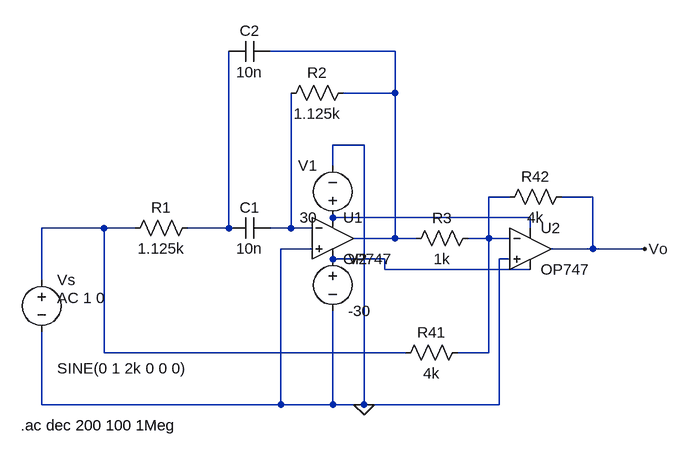
[diagram p0: schematic stage3_allpass_delay_45us_corrected.asc]
stage3_allpass_delay_45us_corrected.asc, the LTspice schematic file:
Version 4.1
SHEET 1 880 680
WIRE 304 -160 112 -160
WIRE 304 -96 304 -160
WIRE 304 -96 224 -96
WIRE 256 -16 208 -16
WIRE 208 16 208 -16
WIRE 480 64 448 64
WIRE 608 64 560 64
WIRE 512 96 208 96
WIRE -144 112 -240 112
WIRE -96 112 -144 112
WIRE 48 112 48 -160
WIRE 48 112 -16 112
WIRE 144 112 144 -96
WIRE 144 112 112 112
WIRE 176 112 144 112
WIRE 512 112 512 96
WIRE 304 128 304 -96
WIRE 304 128 240 128
WIRE 336 128 304 128
WIRE 448 128 448 64
WIRE 448 128 416 128
WIRE 480 128 448 128
WIRE 176 144 128 144
WIRE 608 144 608 64
WIRE 608 144 544 144
WIRE 688 144 608 144
WIRE 288 160 208 160
WIRE 480 160 464 160
WIRE 288 176 288 160
WIRE 512 176 288 176
WIRE -240 192 -240 112
WIRE -144 304 -144 112
WIRE 320 304 -144 304
WIRE 448 304 448 128
WIRE 448 304 400 304
WIRE -240 384 -240 272
WIRE 128 384 128 144
WIRE 128 384 -240 384
WIRE 208 384 208 240
WIRE 208 384 128 384
WIRE 256 384 256 -16
WIRE 256 384 208 384
WIRE 464 384 464 160
WIRE 464 384 256 384
FLAG 688 144 Vo
FLAG 256 384 0
SYMBOL OpAmps\\OP747 208 64 R0
SYMATTR InstName U1
SYMBOL OpAmps\\OP747 512 80 R0
SYMATTR InstName U2
SYMBOL cap 112 96 R90
WINDOW 0 0 32 VBottom 2
WINDOW 3 32 32 VTop 2
SYMATTR InstName C1
SYMATTR Value 10n
SYMBOL cap 112 -176 R90
WINDOW 0 0 32 VBottom 2
WINDOW 3 32 32 VTop 2
SYMATTR InstName C2
SYMATTR Value 10n
SYMBOL res 0 96 R90
WINDOW 0 0 56 VBottom 2
WINDOW 3 32 56 VTop 2
SYMATTR InstName R1
SYMATTR Value 1.125k
SYMBOL res 240 -112 R90
WINDOW 0 0 56 VBottom 2
WINDOW 3 32 56 VTop 2
SYMATTR InstName R2
SYMATTR Value 1.125k
SYMBOL voltage 208 112 R180
WINDOW 0 24 96 Left 2
WINDOW 3 24 16 Left 2
SYMATTR InstName V1
SYMATTR Value 30
SYMBOL voltage 208 144 R0
SYMATTR InstName V2
SYMATTR Value -30
SYMBOL res 432 112 R90
WINDOW 0 0 56 VBottom 2
WINDOW 3 32 56 VTop 2
SYMATTR InstName R3
SYMATTR Value 1k
SYMBOL res 416 288 R90
WINDOW 0 0 56 VBottom 2
WINDOW 3 32 56 VTop 2
SYMATTR InstName R41
SYMATTR Value 4k
SYMBOL res 576 48 R90
WINDOW 0 0 56 VBottom 2
WINDOW 3 32 56 VTop 2
SYMATTR InstName R42
SYMATTR Value 4k
SYMBOL voltage -240 176 R0
WINDOW 3 24 152 Left 2
WINDOW 123 24 44 Left 2
WINDOW 39 0 0 Left 0
SYMATTR Value SINE(0 1 2k 0 0 0)
SYMATTR Value2 AC 1 0
SYMATTR InstName Vs
TEXT -272 416 Left 2 !.ac dec 200 100 1Meg

The netlist it stands for:
* stage3_allpass_delay_45us_corrected.asc
X§U1 0 N006 N003 N007 N001 OP747  ; pins In+ In- V+ V- OUT
X§U2 0 N002 N003 N007 Vo OP747  ; pins In+ In- V+ V- OUT
C1 N006 N005 10n
C2 N001 N005 10n
R1 N005 N004 1.125k
R2 N001 N006 1.125k
V1 N003 0 30
V2 N007 0 -30
R3 N002 N001 1k
R41 N002 N004 4k
R42 Vo N002 4k
Vs N004 0 SINE(0 1 2k 0 0 0) AC 1 0
.ac dec 200 100 1Meg
.backanno
.end